# Altium schematic sheet Battery Monitoring.SchDoc
size A; SheetNumber: 3; SheetTotal: 5
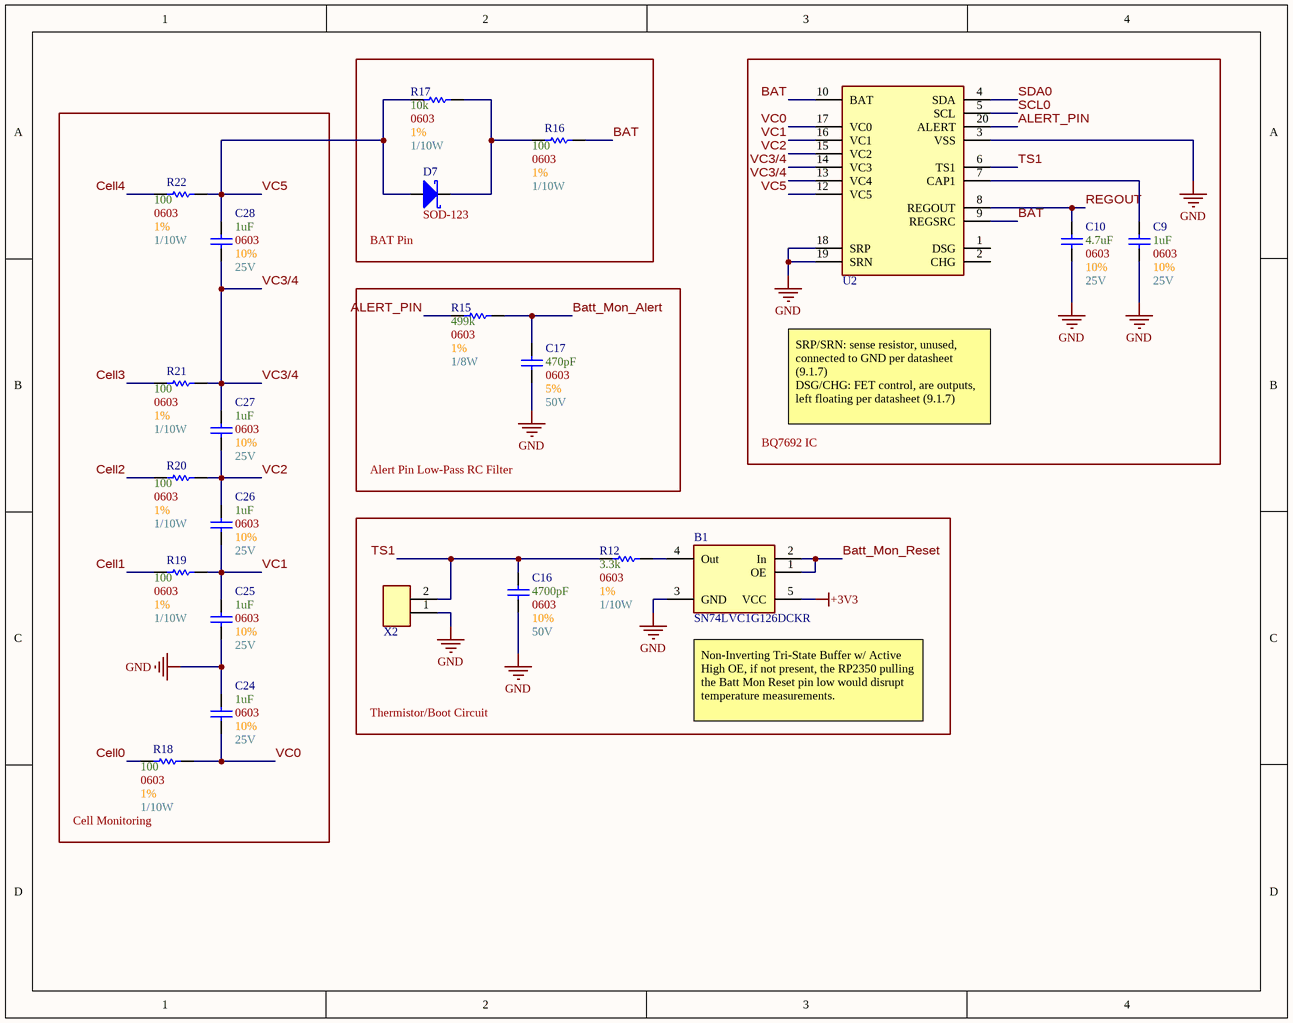
[diagram p0: Battery Monitoring.SchDoc]

## Parts
B1  SN74LVC1G126DCKR  [5-TSSOP, SC-70-5, SOT-353]
C9  Max Voltage: 25V  Size Package: 0603  Tolerance: 10%  Capacitance: 1uF  [[Cap] SMD 0603]  (hidden comment: [Cap] 0603 1uF 10% 25V)
C10  Max Voltage: 25V  Size Package: 0603  Tolerance: 10%  Capacitance: 4.7uF  [[Cap] SMD 0603]  (hidden comment: [Cap] 0603 4.7uF 10% 25V)
C16  Max Voltage: 50V  Size Package: 0603  Tolerance: 10%  Capacitance: 4700pF  [[Cap] SMD 0603]  (hidden comment: [Cap] 0603 4700pF 10% 50V)
C17  Max Voltage: 50V  Size Package: 0603  Tolerance: 5%  Capacitance: 470pF  [[Cap] SMD 0603]  (hidden comment: [Cap] 0603 470pF 5% 50V)
C24  Max Voltage: 25V  Size Package: 0603  Tolerance: 10%  Capacitance: 1uF  [[Cap] SMD 0603]  (hidden comment: [Cap] 0603 1uF 10% 25V)
C25  Max Voltage: 25V  Size Package: 0603  Tolerance: 10%  Capacitance: 1uF  [[Cap] SMD 0603]  (hidden comment: [Cap] 0603 1uF 10% 25V)
C26  Max Voltage: 25V  Size Package: 0603  Tolerance: 10%  Capacitance: 1uF  [[Cap] SMD 0603]  (hidden comment: [Cap] 0603 1uF 10% 25V)
C27  Max Voltage: 25V  Size Package: 0603  Tolerance: 10%  Capacitance: 1uF  [[Cap] SMD 0603]  (hidden comment: [Cap] 0603 1uF 10% 25V)
C28  Max Voltage: 25V  Size Package: 0603  Tolerance: 10%  Capacitance: 1uF  [[Cap] SMD 0603]  (hidden comment: [Cap] 0603 1uF 10% 25V)
D7  Footprint: SOD-123  [[Diode] SMD SOD-123]  (hidden comment: SOD123)
R12  Wattage: 1/10W  Tolerance: 1%  Resistance: 3.3k  Size Package: 0603  [[Res] SMD 0603]  (hidden comment: [3.3k] SMD 0603 1% 1/10W)
R15  Wattage: 1/8W  Tolerance: 1%  Resistance: 499k  Size Package: 0603  [[Res] SMD 0603]  (hidden comment: [499k] SMD 0603 1% 1/8W)
R16  Wattage: 1/10W  Tolerance: 1%  Resistance: 100  Size Package: 0603  [[Res] SMD 0603]  (hidden comment: [100] SMD 0603 1% 1/10W)
R17  Wattage: 1/10W  Tolerance: 1%  Resistance: 10k  Size Package: 0603  [[Res] SMD 0603]  (hidden comment: [10k] SMD 0603 1% 1/10W)
R18  Wattage: 1/10W  Tolerance: 1%  Resistance: 100  Size Package: 0603  [[Res] SMD 0603]  (hidden comment: [100] SMD 0603 1% 1/10W)
R19  Wattage: 1/10W  Tolerance: 1%  Resistance: 100  Size Package: 0603  [[Res] SMD 0603]  (hidden comment: [100] SMD 0603 1% 1/10W)
R20  Wattage: 1/10W  Tolerance: 1%  Resistance: 100  Size Package: 0603  [[Res] SMD 0603]  (hidden comment: [100] SMD 0603 1% 1/10W)
R21  Wattage: 1/10W  Tolerance: 1%  Resistance: 100  Size Package: 0603  [[Res] SMD 0603]  (hidden comment: [100] SMD 0603 1% 1/10W)
R22  Wattage: 1/10W  Tolerance: 1%  Resistance: 100  Size Package: 0603  [[Res] SMD 0603]  (hidden comment: [100] SMD 0603 1% 1/10W)
U2  [Batt Mon] 3-5 Cell BMS  [[Batt Mon] 3-5 Cell BMS]  (value not drawn)
X2  [Sherlock] 2pin  [[Sherlock] 2pin]  (value not drawn)

## Blocks framed on the sheet
BAT Pin: D7 R16 R17
BQ7692 IC: C9 C10 U2
Cell Monitoring: C24-C28 R18-R22
Alert Pin Low-Pass RC Filter: C17 R15
Thermistor/Boot Circuit: B1 C16 R12 X2

## Nets
+3V3: B1.5(VCC)
GND: B1.3(GND) C9.1 C10.1 C16.1 C17.1 C24.2 C25.1 U2.3(VSS) U2.18(SRP) U2.19(SRN) X2.1
ALERT_PIN: R15.1 U2.20(ALERT)
BAT: R16.2 U2.9(REGSRC) U2.10(BAT)
Batt_Mon_Alert: C17.2 R15.2
Batt_Mon_Reset: B1.1(OE) B1.2(In)
Cell0: R18.1
Cell1: R19.1
Cell2: R20.1
Cell3: R21.1
Cell4: R22.1
REGOUT: C10.2 U2.8(REGOUT)
SCL0: U2.5(SCL)
SDA0: U2.4(SDA)
TS1: C16.2 R12.2 U2.6(TS1) X2.2
VC0: C24.1 R18.2 U2.17(VC0)
VC1: C25.2 C26.1 R19.2 U2.16(VC1)
VC2: C26.2 C27.1 R20.2 U2.15(VC2)
VC3/4: C27.2 C28.1 R21.2 U2.13(VC4) U2.14(VC3)
VC5: C28.2 D7.2(A) R17.1 R22.2 U2.12(VC5)
NetB1_4: B1.4(Out) R12.1
NetC9_2: C9.2 U2.7(CAP1)
NetD7_1: D7.1(K) R16.1 R17.2

Not connected (* = marked no-connect by the designer): U2 1(DSG) 2(CHG)

## Notes on the sheet
- SRP/SRN: sense resistor, unused, connected to GND per datasheet (9.1.7)
  DSG/CHG: FET control, are outputs, left floating per datasheet (9.1.7)
- (near B1) Non-Inverting Tri-State Buffer w/ Active High OE, if not present, the RP2350 pulling the Batt Mon Reset pin low would disrupt temperature measurements.

## Library data of the parts
B1 = [Buffer] Single Tri-State Active-High OE: Supplier 1: DigiKey; Supplier Part Number 1: 296-11606-6-ND
C9 C24-C28 = [Cap] 0603 1uF 10% 25V: CL10B105KA8NNNC; Supplier 1: DigiKey; Supplier Part Number 1: 1276-1184-1-ND
C10 = [Cap] 0603 4.7uF 10% 25V: GRM188R61E475KE11D; Supplier 1: DigiKey; Supplier Part Number 1: 490-7203-6-ND
C16 = [Cap] 0603 4700pF 10% 50V: CL10B472KB8WPNC; Supplier 1: DigiKey; Supplier Part Number 1: 1276-6532-1-ND
C17 = [Cap] 0603 470pF 5% 50V: C0603C471J5GACTU; Supplier 1: DigiKey; Supplier Part Number 1: 399-C0603C471J5GACTUDKR-ND
D7 = [Schottky] SMD 40V 1A: B5819W-TP; Supplier 1: DigiKey; Supplier Part Number 1: B5819W-TPMSCT-ND
R12 = [3.3k] SMD 0603 1% 1/10W: RC0603FR-073K3L; Supplier 1: DigiKey; Supplier Part Number 1: 311-3.30KHRCT-ND
R15 = [499k] SMD 0603 1% 1/8W: CRCW0603499KFKEA; Supplier 1: DigiKey; Supplier Part Number 1: 541-499KHCT-ND
R16 R18-R22 = [100] SMD 0603 1% 1/10W: RC0603FR-07100RL; Supplier 1: DigiKey; Supplier Part Number 1: 311-100HRDKR-ND
R17 = [10k] SMD 0603 1% 1/10W: RMCF0603FT10K0; Supplier 1: DigiKey; Supplier Part Number 1: RMCF0603FT10K0DKR-ND
U2 = [Batt Mon] 3-5 Cell BMS: BQ7692006PWR; Supplier 1: DigiKey; Supplier Part Number 1: 296-39960-1-ND
X2 = [Sherlock] 2pin: 0353620250; Supplier 1: DigiKey; Supplier Part Number 1: WM18920-ND